# Altium project OFP_MCM_v1.6.PrjPcb (part 5 of 7)
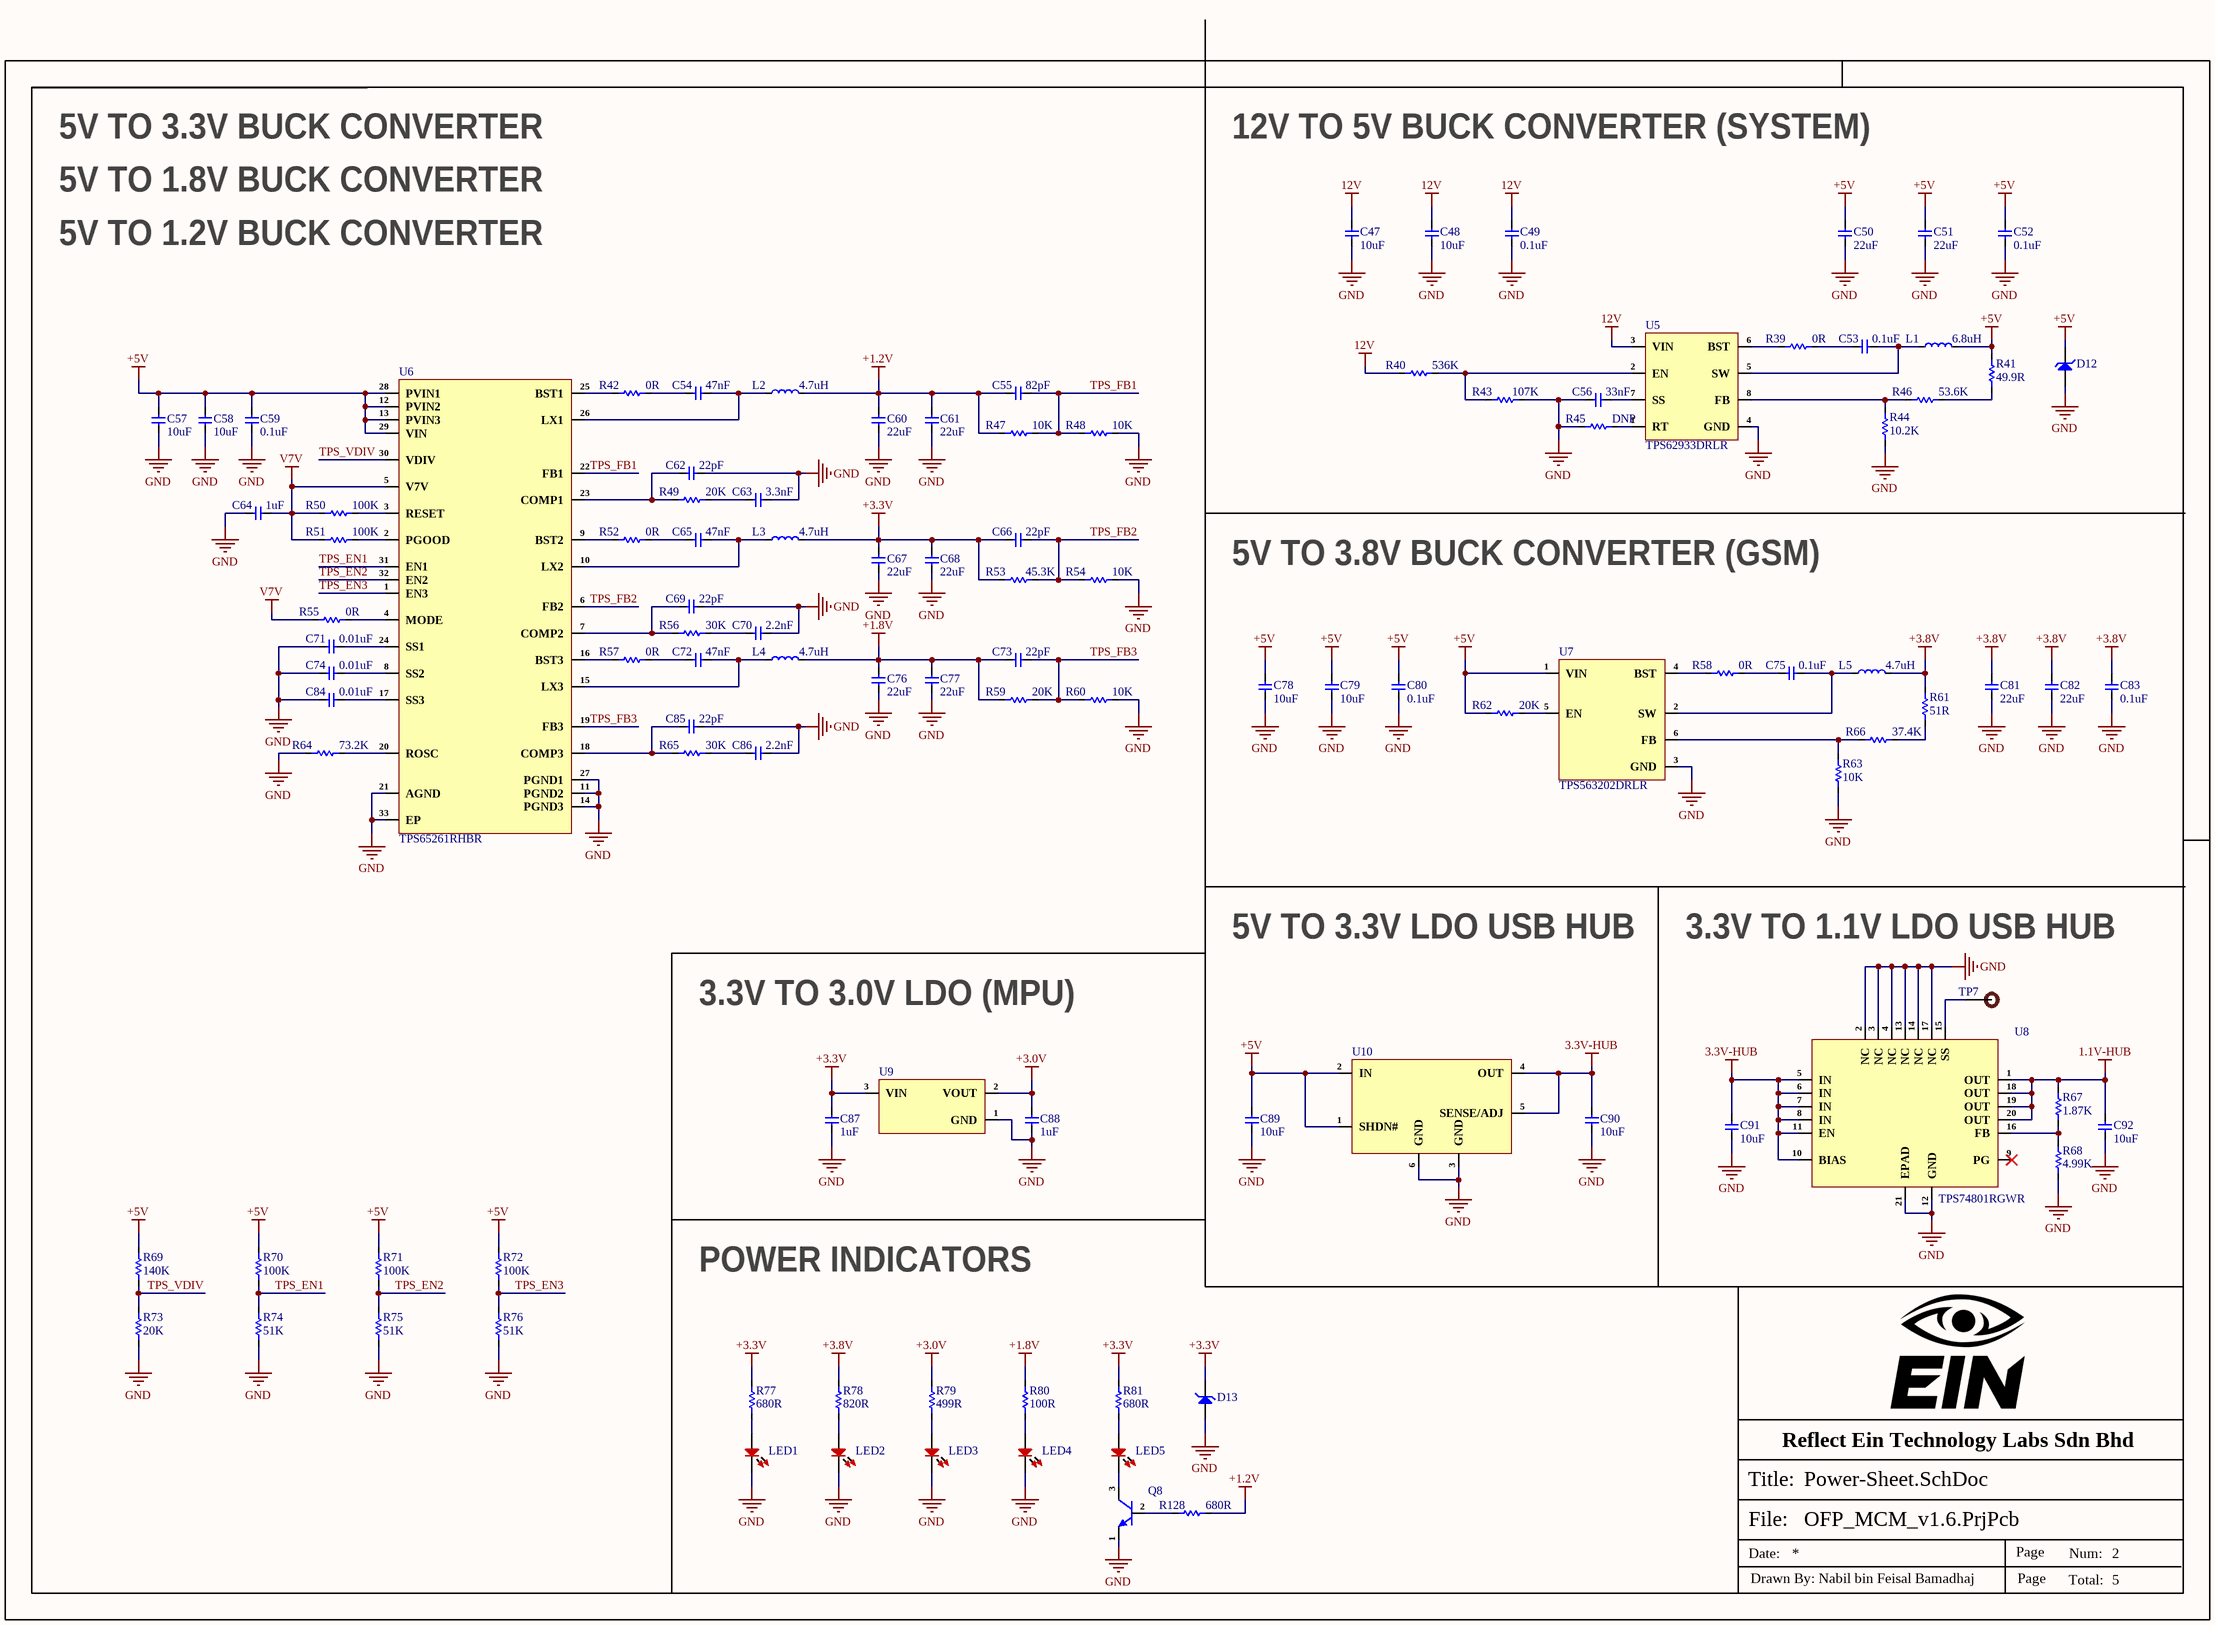
[diagram p8: Power-Sheet.SchDoc]

## Sheet Power-Sheet.SchDoc (continued)

### Library data of the parts (continued)
R74-R76 = RC0603FR-0751KL: RES 51K OHM 1% 1/10W 0603; Manufacturer: Yageo; Item Type: Resistors; Value: 51kR; Power Rating: 100mW; Voltage Rating: 50V; Temperature Coefficient: 100ppm/°C; Supplier: Future Electronics; LCSC Part Number: C107231; Manufacturer Part Number: RC0603FR-0751KL; RoHS: Yes; Stock: 1155000; Pricing: 5000=0.0024, 50000=0.0023, 150000=0.0022, 375000=0.0021, 1000000=0.002 (USD); Case/Package: 0603; Pins: 2NUMBER; Case Code (Imperial): 0603; Case Code (Metric): 1608; Min Operating Temperature: -55°C; Max Operating Temperature: 155°C; Tolerance: 1%; Packaging: Tape and Reel; Package Quantity: 1; Termination: SMD/SMT; Resistor Type: Thick Film; Number of Terminations: 2; Max Power Dissipation: 100mW; Features: Moisture Resistant; Series: RC; Resistance Tolerance: 1%; Technology: THICK FILM; Voltage Rating (DC): 50V; Length: 1.6mm; Width: 0.031inch; Height: 0.45mm; Depth: 0.8mm; Reach SVHC Compliant: No; RoHS Compliant: Yes; Lead Free: 5697LeadFree; ComponentLink1URL: https://datasheet.ciiva.com/11819/0900766b80f96399-11819378.pdf?src-supplier=Rs; ComponentLink1Description: https://datasheet.ciiva.com/11819/0900766b80f96399-11819378.pdf?src-supplier=Rs; ComponentLink2URL: https://datasheet.ciiva.com/46395/443971-46395014.pdf?src-supplier=Element14; ComponentLink2Description: https://datasheet.ciiva.com/46395/443971-46395014.pdf?src-supplier=Element14; ComponentLink3URL: https://datasheet.ciiva.com/2454/pyu-r-int-thick-7-2454124.pdf?src-supplier=Digikey; ComponentLink3Description: https://datasheet.ciiva.com/2454/pyu-r-int-thick-7-2454124.pdf?src-supplier=Digikey; ComponentLink4URL: https://datasheet.ciiva.com/2454/pyu-r-int-thick-7-2454125.pdf?src-supplier=Digikey; ComponentLink4Description: https://datasheet.ciiva.com/2454/pyu-r-int-thick-7-2454125.pdf?src-supplier=Digikey; ComponentLink5URL: https://datasheet.ciiva.com/2454/pyu-r-int-thick-7-2454123.pdf?src-supplier=Digikey; ComponentLink5Description: https://datasheet.ciiva.com/2454/pyu-r-int-thick-7-2454123.pdf?src-supplier=Digikey; ComponentLink6URL: https://datasheet.ciiva.com/12558/rc0603-272842-12558554.pdf?src-supplier=Mouser; ComponentLink6Description: https://datasheet.ciiva.com/12558/rc0603-272842-12558554.pdf?src-supplier=Mouser
R77 R81 R128 = RC0603FR-07680RL: RES SMD 680 OHM 1% 1/10W 0603; Manufacturer: Yageo; Item Type: Resistor; Manufacturer Part Number: RC0603FR-07680RL; Package: 0603; ComponentLink4URL: https://www.lcsc.com/product-detail/Chip-Resistor-Surface-Mount_YAGEO-RC0603FR-07680RL_C112310.html; ComponentLink4Description: LCSC; LCSC Part Number: C112310
R78 = RC0603FR-07820RL: RES 820 OHM 1% 1/10W 0603; Manufacturer: Yageo; Power Rating: 100mW; Voltage Rating: 75V; Voltage Rating (DC): 50V; Temperature Coefficient: 100ppm/°C; Item Type: Resistor; Supplier 1: Future Electronics; Manufacturer Part Number: RC0603FR-07820RL; RoHS: Yes; Category: Chip SMD Resistors; Stock 1: 415000; Pricing 1: 5000=0.002, 50000=0.0014, 100000=0.0018, 200000=0.0014, 375000=0.0018, 625000=0.0013, 1000000=0.0017, 2000000=0.0012, 3750000=0.0016 (USD); Case/Package: 0603; Pins: 2; Case Code (Imperial): 0603; Case Code (Metric): 1608; Weight: 7.1E-05oz; Min Operating Temperature: -55°C; Max Operating Temperature: 155°C; Tolerance: 1%; Value: 820R; Packaging: Tape and Reel; Termination: SMD/SMT; Resistor Type: Thick Film; Features: Moisture Resistant; Series: RC; Max Power Dissipation: 100mW; Number of Terminations: 2; Construction: Rectangular; Resistance Tolerance: 1%; Technology: THICK FILM; Length: 1.6mm; Width: 0.8mm; Height: 0.45mm; Depth: 0.8mm; Military Standard: Not; Lead Free: Lead Free; RoHS Compliant: Yes; Reach SVHC Compliant: Unknown; ComponentLink1URL: http://www.farnell.com/datasheets/1868787.pdf?src-supplier=Farnell; ComponentLink1Description: http://www.farnell.com/datasheets/1868787.pdf?src-supplier=Farnell; ComponentLink2URL: http://www.mouser.com/ds/2/447/RC0603-272842.pdf?src-supplier=Mouser; ComponentLink2Description: http://www.mouser.com/ds/2/447/RC0603-272842.pdf?src-supplier=Mouser; ComponentLink3URL: http://www.farnell.com/datasheets/2167052.pdf?src-supplier=Farnell; ComponentLink3Description: http://www.farnell.com/datasheets/2167052.pdf?src-supplier=Farnell; ComponentLink4URL: https://www.verical.com/server-webapp/html/getDatasheet?partID=358925&src-supplier=Verical; ComponentLink4Description: https://www.verical.com/server-webapp/html/getDatasheet?partID=358925&src-supplier=Verical; ComponentLink5URL: http://www.farnell.com/datasheets/1868787.pdf?src-supplier=Newark; ComponentLink5Description: http://www.farnell.com/datasheets/1868787.pdf?src-supplier=Newark; ComponentLink6URL: http://www.farnell.com/datasheets/1868787.pdf?src-supplier=Element14; ComponentLink6Description: http://www.farnell.com/datasheets/1868787.pdf?src-supplier=Element14; ComponentLink7URL: http://www.yageo.com/documents/recent/PYu-RC_Group_51_RoHS_L_10.pdf?src-supplier=Digi-Key; ComponentLink7Description: http://www.yageo.com/documents/recent/PYu-RC_Group_51_RoHS_L_10.pdf?src-supplier=Digi-Key; ComponentLink8URL: http://www.yageo.com/documents/recent/PYu-RC_Group_51_RoHS_L_9.pdf?src-supplier=Digi-Key; ComponentLink8Description: http://www.yageo.com/documents/recent/PYu-RC_Group_51_RoHS_L_9.pdf?src-supplier=Digi-Key; ComponentLink9URL: http://www.farnell.com/datasheets/2167052.pdf?src-supplier=Newark; ComponentLink9Description: http://www.farnell.com/datasheets/2167052.pdf?src-supplier=Newark; ComponentLink10URL: http://www.yageo.com/documents/recent/PYu-RC0603_51_RoHS_L_7.pdf?src-supplier=Future+Electronics; ComponentLink10Description: http://www.yageo.com/documents/recent/PYu-RC0603_51_RoHS_L_7.pdf?src-supplier=Future+Electronics; Supplier Part Number 1: 8621260; LCSC Part Number: C114638
R79 = RC0603FR-07499RL: RES 499 OHM 1% 1/10W 0603; Manufacturer: Yageo; Temperature Coefficient: 100ppm/°C; Power Rating: 100mW; Voltage Rating: 50V; Supplier 1: RSComponents; Manufacturer Part Number: RC0603FR-07499RL; RoHS: Yes; Category: Chip SMD Resistors; Stock 1: 900; Pricing 1: 5000=0.00300, 10000=0.00300, 15000=0.00300, 20000=0.00200 (GBP); Mount: Surface Mount; Case/Package: 0603; Contact Plating: Tin,Matte; Case Code (Metric): 1608; Case Code (Imperial): 0603; Size Code: 0603; Min Operating Temperature: -55°C; Max Operating Temperature: 155°C; Resistance: 499R; Tolerance: 1%; Resistor Type: Thick Film; Package Quantity: 1; Packaging: Tape and Reel; Number of Terminations: 2; Termination: SMD/SMT; Max Power Dissipation: 100mW; Voltage Rating (DC): 50V; Features: Moisture Resistant; Series: RC; Construction: Rectangular; Technology: THICK FILM; Length: 1.6mm; Width: 0.031inch; Height: 0.45mm; Depth: 0.8mm; Radiation Hardening: No; Military Standard: Not; Lead Free: Lead Free; RoHS Compliant: Yes; ComponentLink1URL: https://datasheet.ciiva.com/11808/0900766b80f96399-11808558.pdf?src-supplier=RSComponents; ComponentLink1Description: https://datasheet.ciiva.com/11808/0900766b80f96399-11808558.pdf?src-supplier=RSComponents; ComponentLink2URL: https://datasheet.ciiva.com/2453/pyu-r-int-thick-7-2453956.pdf?src-supplier=Digi-Key; ComponentLink2Description: https://datasheet.ciiva.com/2453/pyu-r-int-thick-7-2453956.pdf?src-supplier=Digi-Key; ComponentLink3URL: https://datasheet.ciiva.com/2453/pyu-r-int-thick-7-2453957.pdf?src-supplier=Digi-Key; ComponentLink3Description: https://datasheet.ciiva.com/2453/pyu-r-int-thick-7-2453957.pdf?src-supplier=Digi-Key; ComponentLink4URL: https://datasheet.ciiva.com/2453/pyu-r-int-thick-7-2453955.pdf?src-supplier=Digi-Key; ComponentLink4Description: https://datasheet.ciiva.com/2453/pyu-r-int-thick-7-2453955.pdf?src-supplier=Digi-Key; ComponentLink5URL: https://datasheet.ciiva.com/12558/rc0603-272842-12558391.pdf?src-supplier=Mouser; ComponentLink5Description: https://datasheet.ciiva.com/12558/rc0603-272842-12558391.pdf?src-supplier=Mouser; ComponentLink6URL: https://datasheet.ciiva.com/8885/pyu-rc0603-51-rohs-l-4-8885483.pdf?src-supplier=Avnet; ComponentLink6Description: https://datasheet.ciiva.com/8885/pyu-rc0603-51-rohs-l-4-8885483.pdf?src-supplier=Avnet; Supplier Part Number 1: 1995585; LCSC Part Number: C137714
R80 = RC0603FR-07100RL: RES SMD 100 OHM 1% 1/10W 0603; Manufacturer: Yageo; Temperature Coefficient: 100ppm/°C; Voltage Rating (DC): 50V; Power Rating: 100mW; Item Type: Resistor; Supplier 1: Arrow Electronics; Manufacturer Part Number: RC0603FR-07100RL; RoHS: Yes; Category: Chip SMD Resistors; Stock 1: 3800000; Pricing 1: 5000=0.00300, 5000=0.00200, 5000=0.00450, 50000=0.00410, 500000=0.00230, 2500000=0.00140 (USD); Case/Package: 0603; Number of Pins: 2; Case Code (Imperial): 0603; Case Code (Metric): 1608; Size Code: 0603; Min Operating Temperature: -55°C; Max Operating Temperature: 155°C; Resistance: 100R; Tolerance: 1%; Resistor Type: Thick Film; Packaging: Tape and Reel; Voltage Rating: 50V; Termination: SMD/SMT; Features: Moisture Resistant; Series: RC; Max Power Dissipation: 100mW; Number of Terminations: 2; Construction: Rectangular; Resistance Tolerance: 1%; Technology: THICK FILM; Length: 1.6mm; Width: 0.8mm; Height: 0.45mm; Depth: 0.8mm; REACH SVHC: Unknown; Lead Free: Lead Free; RoHS Compliant: Yes; Military Standard: Not; Supplier Part Number 1: RC0603FR-07100RL; LCSC Part Number: C105588
TP7 = TEST POINT 0.5mm Dia: Test Point ON; Item Type: Test Point; Manufacturer Part Number: TEST POINT 0.5mm Dia
U5 = TPS62933DRLR: IC REG BUCK ADJ 3A SOT583; Manufacturer: Texas Instruments; Supplier: Mouser; Supplier Part Number: 595-TPS62933DRLR; Manufacturer Part Number: TPS62933DRLR; RoHS: No; Category: Voltage Regulators - Switching; Stock: 5259; Pricing: 1=0.7, 10=0.581, 50=0.581, 100=0.44, 1000=0.297, 10000=0.241 (USD); LCSC Part Number: C3200405; Item Type: IC
U6 = TPS65261RHBR: IC REG BCK ADJ 3A/2A TRPL 32VQFN; Manufacturer: Texas Instruments; Supplier: Mouser; LCSC Part Number: C138722; Manufacturer Part Number: TPS65261RHBR; RoHS: Yes; Item Type: IC; Stock: 3449; Pricing: 1=2.78, 10=1.91, 50=1.91, 100=1.71, 1000=1.52, 10000=1.32 (USD); ComponentLink1URL: https://datasheet.ciiva.com/29735/tps65261-1-29735186.pdf?src-supplier=Digikey; ComponentLink1Description: https://datasheet.ciiva.com/29735/tps65261-1-29735186.pdf?src-supplier=Digikey
U7 = TPS563202DRLR: IC REG BUCK ADJ 3A SOT563; Manufacturer: Texas Instruments; Number of Channels: 1NUMBER; Supplier: Mouser; LCSC Part Number: C1513007; Manufacturer Part Number: TPS563202DRLR; RoHS: Yes; Item Type: IC; Stock: 5123; Pricing: 1=0.29, 10=0.174, 50=0.174, 100=0.131, 1000=0.125, 10000=0.109 (USD); Pins: 6NUMBER; Length: 1.6mm; Width: 1.2mm; Height: 600um; Thickness: 550um
U8 = TPS74801RGWR: IC REG LIN POS ADJ 1.5A 20VQFN; Manufacturer: Texas Instruments; Supplier: Mouser; LCSC Part Number: C129193; Manufacturer Part Number: TPS74801RGWR; RoHS: Yes; Item Type: IC; Stock: 12482; Pricing: 1=1.87, 10=1.33, 50=1.33, 100=1.19, 1000=1.04, 10000=1.03 (USD); Length: 5mm; Width: 5mm; Height: 1mm; Thickness: 900um; ComponentLink1URL: https://datasheet.ciiva.com/4885/sbvs074j-203573-4885874.pdf?src-supplier=Mouser; ComponentLink1Description: https://datasheet.ciiva.com/4885/sbvs074j-203573-4885874.pdf?src-supplier=Mouser; ComponentLink2URL: https://datasheet.ciiva.com/41462/001015037-da-01-en-ic-reg-ldo-adj-tps74801rgwr-vqfn-20-tid-41462882.pdf?src-supplier=Conrad; ComponentLink2Description: https://datasheet.ciiva.com/41462/001015037-da-01-en-ic-reg-ldo-adj-tps74801rgwr-vqfn-20-tid-41462882.pdf?src-supplier=Conrad; ComponentLink3URL: https://datasheet.ciiva.com/14278/tps74801-14278399.pdf?src-supplier=Avnet; ComponentLink3Description: https://datasheet.ciiva.com/14278/tps74801-14278399.pdf?src-supplier=Avnet; ComponentLink4URL: https://datasheet.ciiva.com/31402/tps74801-31402076.pdf?src-supplier=Farnell; ComponentLink4Description: https://datasheet.ciiva.com/31402/tps74801-31402076.pdf?src-supplier=Farnell; ComponentLink5URL: https://datasheet.ciiva.com/2044/tps74801-2044836.pdf?src-supplier=Digikey; ComponentLink5Description: https://datasheet.ciiva.com/2044/tps74801-2044836.pdf?src-supplier=Digikey; ComponentLink6URL: https://datasheet.ciiva.com/2044/tps74801-2044837.pdf?src-supplier=Digikey; ComponentLink6Description: https://datasheet.ciiva.com/2044/tps74801-2044837.pdf?src-supplier=Digikey; ComponentLink7URL: https://datasheet.ciiva.com/2044/tps74801-2044838.pdf?src-supplier=Digikey; ComponentLink7Description: https://datasheet.ciiva.com/2044/tps74801-2044838.pdf?src-supplier=Digikey
U9 = XC6206P302MR-G: IC REG LINEAR 3V 200MA SOT23; Manufacturer: Torex; Number of Channels: 1NUMBER; Supplier: Mouser; LCSC Part Number: C9972; Manufacturer Part Number: XC6206P302MR-G; RoHS: Yes; Item Type: IC; Stock: 15826; Pricing: 1=0.68, 10=0.543, 50=0.543, 100=0.417, 1000=0.271, 10000=0.214 (USD); Output Voltage: 3V; ComponentLink1URL: https://www.torexsemi.com/file/xc6206/XC6206.pdf?src-supplier=Digikey; ComponentLink1Description: https://www.torexsemi.com/file/xc6206/XC6206.pdf?src-supplier=Digikey; ComponentLink2URL: https://datasheet.octopart.com/XC6206P302MR-G-Torex-datasheet-134531119.pdf?src-supplier=TME; ComponentLink2Description: https://datasheet.octopart.com/XC6206P302MR-G-Torex-datasheet-134531119.pdf?src-supplier=TME
U10 = TPS7A4533DCQR: IC REG LINEAR 3.3V 1.5A SOT223-6; Manufacturer: Texas Instruments; Dropout Voltage: 300mV; Number of Outputs: 1; Max Supply Voltage: 20V; Min Input Voltage: 2.1V; Min Current Limit: 1.6A; Input Bias Current: 1mA; Polarity: Positive; Accuracy: 1%; Output Type: Fixed; Supplier: Mouser; LCSC Part Number: 595-TPS7A4533DCQR; Manufacturer Part Number: TPS7A4533DCQR; RoHS: Yes; Item Type: IC; Stock: 854; Pricing: 1=3.2, 10=2.35, 50=2.35, 100=2.14, 1000=2, 10000=1.87 (USD); Case/Package: SOT-223-6; Pins: 6; Min Operating Temperature: -40°C; Max Operating Temperature: 125°C; Output Voltage: 3.3V; Package Quantity: 2500; Packaging: Tape and Reel; Output Current: 1.5A; Max Output current: 1.5A; Number of Regulators: 1; Quiescent Current: 1mA; Max Output Voltage: 3.3V; Min Output Voltage: 3.3V; Series: -; Radiation Hardening: No; Lead Free: Lead Free; RoHS Compliant: Yes; ComponentLink1URL: https://datasheet.ciiva.com/2046/tps7a4515-2046240.pdf?src-supplier=Digikey; ComponentLink1Description: https://datasheet.ciiva.com/2046/tps7a4515-2046240.pdf?src-supplier=Digikey; ComponentLink2URL: https://datasheet.ciiva.com/29569/tps7a4501-29569717.pdf?src-supplier=Digikey; ComponentLink2Description: https://datasheet.ciiva.com/29569/tps7a4501-29569717.pdf?src-supplier=Digikey; ComponentLink3URL: https://datasheet.ciiva.com/29569/tps7a4501-29569718.pdf?src-supplier=Digikey; ComponentLink3Description: https://datasheet.ciiva.com/29569/tps7a4501-29569718.pdf?src-supplier=Digikey; ComponentLink4URL: https://datasheet.ciiva.com/29569/tps7a4501-29569719.pdf?src-supplier=Digikey; ComponentLink4Description: https://datasheet.ciiva.com/29569/tps7a4501-29569719.pdf?src-supplier=Digikey

## Sheet RGB-LCD-Sheet.SchDoc
size 420 x 297 mm; SheetNumber: 3; SheetTotal: 5
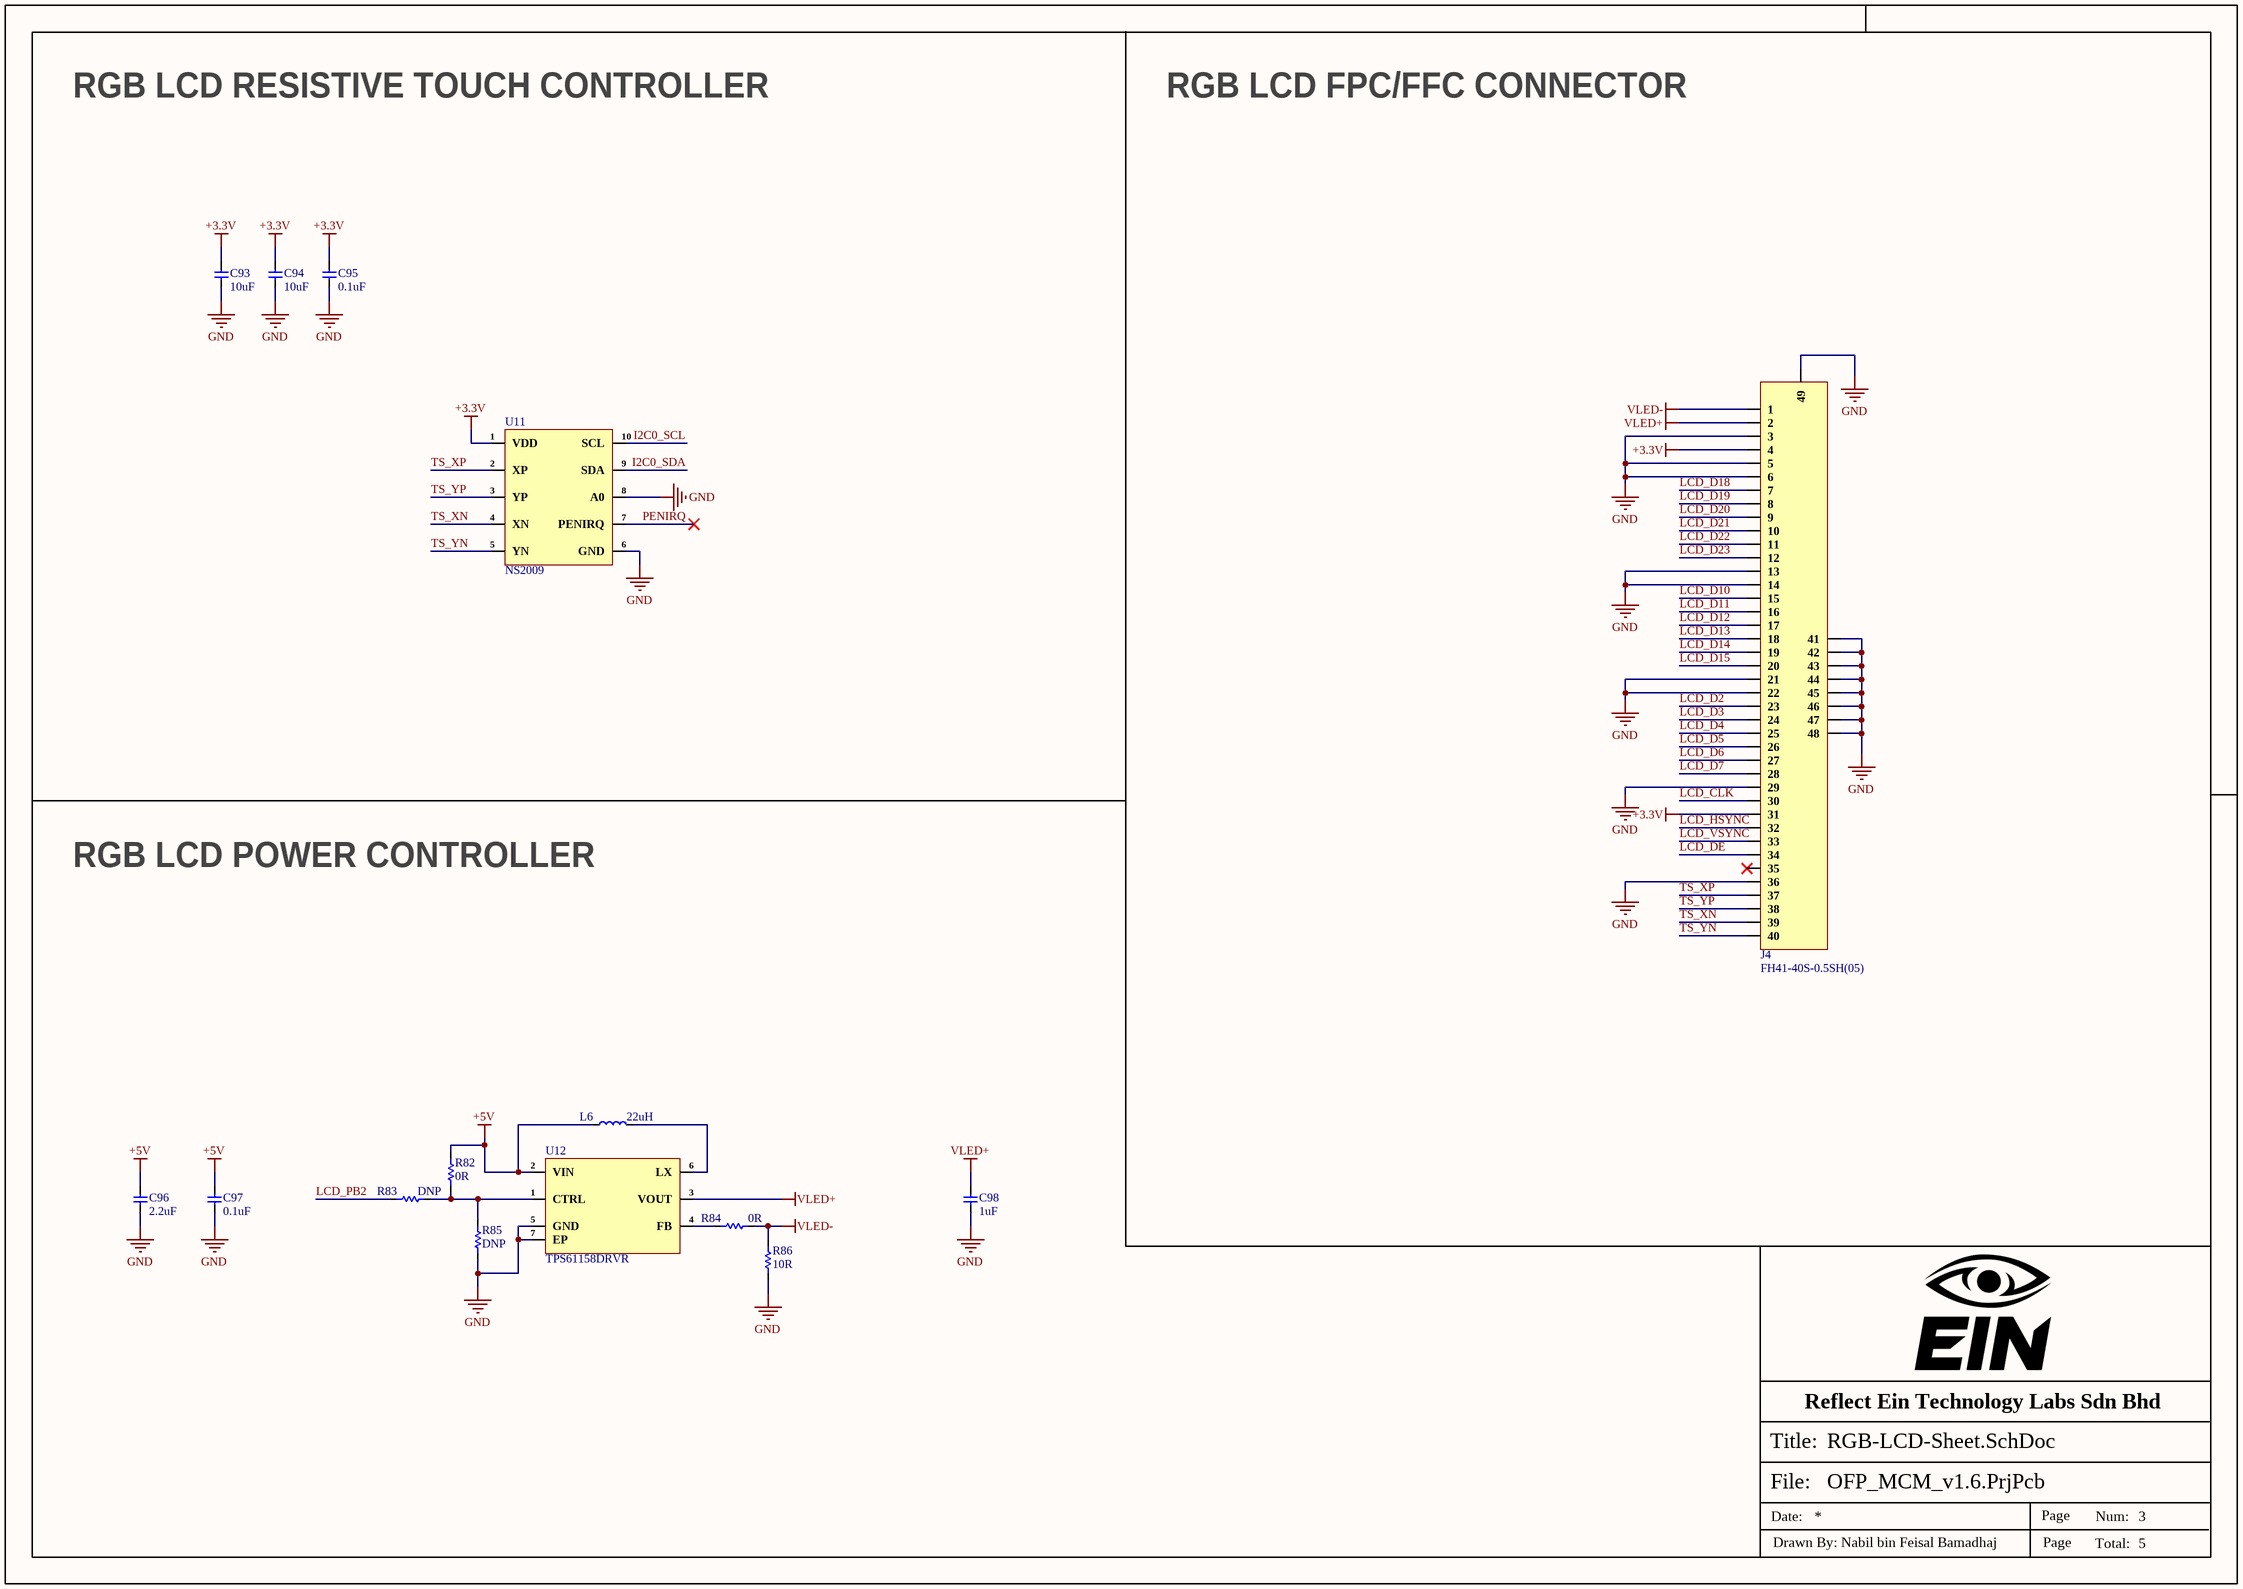
[diagram p2: RGB-LCD-Sheet.SchDoc]

### Parts
C93  10uF  [Cap-0603]
C94  10uF  [Cap-0603]
C95  0.1uF  [Cap-0402]
C96  2.2uF  [Cap-0603]
C97  0.1uF  [Cap-0402]
C98  1uF  [Cap-0603]
J4  FH41-40S-0.5SH(05)  [FH41-40S-0.5SH(05)]
L6  22uH  [YNR4018-220M]
R82  0R  [Res-0603]
R83  DNP  [Res-0603]
R84  0R  [Res-0603]
R85  DNP  [Res-0603]
R86  10R  [Res-0603]
U11  NS2009  [10-MSOP]
U12  TPS61158DRVR  [WSON-6-EP(2x2)]

### Nets
+3.3V: C93.2 C94.2 C95.2 J4.4 J4.31 U11.1(VDD)
+5V: C96.2 C97.2 L6.1 R82.2 U12.2(VIN)
GND: C93.1 C94.1 C95.1 C96.1 C97.1 C98.1 J4.3 J4.5 J4.6 J4.13 J4.14 J4.21 J4.22 J4.29 J4.36 J4.41 J4.42 J4.43 J4.44 J4.45 J4.46 J4.47 J4.48 J4.49 R85.1 R86.1 U11.6(GND) U11.8(A0) U12.5(GND) U12.7(EP)
VLED+: C98.2 J4.2 U12.3(VOUT)
VLED-: J4.1 R84.2 R86.2
I2C0_SCL: U11.10(SCL)
I2C0_SDA: U11.9(SDA)
LCD_CLK: J4.30
LCD_D2: J4.23
LCD_D3: J4.24
LCD_D4: J4.25
LCD_D5: J4.26
LCD_D6: J4.27
LCD_D7: J4.28
LCD_D10: J4.15
LCD_D11: J4.16
LCD_D12: J4.17
LCD_D13: J4.18
LCD_D14: J4.19
LCD_D15: J4.20
LCD_D18: J4.7
LCD_D19: J4.8
LCD_D20: J4.9
LCD_D21: J4.10
LCD_D22: J4.11
LCD_D23: J4.12
LCD_DE: J4.34
LCD_HSYNC: J4.32
LCD_PB2: R83.1
LCD_VSYNC: J4.33
PENIRQ: U11.7(PENIRQ)
TS_XN: J4.39 U11.4(XN)
TS_XP: J4.37 U11.2(XP)
TS_YN: J4.40 U11.5(YN)
TS_YP: J4.38 U11.3(YP)
NetL6_2: L6.2 U12.6(LX)
NetR82_1: R82.1 R83.2 R85.2 U12.1(CTRL)
NetR84_1: R84.1 U12.4(FB)

Not connected (* = marked no-connect by the designer): J4 35*

### Notes on the sheet
- RGB LCD RESISTIVE TOUCH CONTROLLER
- RGB LCD FPC/FFC CONNECTOR
- RGB LCD POWER CONTROLLER
- Reflect Ein Technology Labs Sdn Bhd
- File:
- Title:
- Date:
- Page
- Num:
- Total:
- Drawn By: Nabil bin Feisal Bamadhaj

### Library data of the parts
C93 C94 = GRM188Z71A106KA73D: CAP CER 10UF 10V X7R 0603; Manufacturer: Murata; Item Type: Capacitor; Material: 4241ConductorMaterial; Tolerance: 10%; Supplier: Mouser; LCSC Part Number: C2959727; Manufacturer Part Number: GRM188Z71A106KA73D; RoHS: Yes; Stock: 390983; Pricing: 1=0.36, 10=0.155, 50=0.155, 100=0.104, 1000=0.094, 10000=0.065 (USD); Case/Package: 345Case; Min Operating Temperature: -55°C; Max Operating Temperature: 125°C; Value: 10uF; Voltage Rating: 10V; Length: 1.6mm; Width: 800um; Height: 1mm; Thickness: 800um; RoHS Compliant: Yes; ComponentLink1URL: https://datasheet.octopart.com/GRM188Z71A106KA73D-Murata-datasheet-165579666.pdf?src-supplier=TME; ComponentLink1Description: https://datasheet.octopart.com/GRM188Z71A106KA73D-Murata-datasheet-165579666.pdf?src-supplier=TME
C95 C97 = GRM155R71E104KE14D: CAP CER 0.1UF 25V X7R 0402; Manufacturer: Murata; Item Type: Capacitors; Dielectric Material: Ceramic; Material: 4241ConductorMaterial; Value: 100nF; Tolerance: 10%; Supplier: Mouser; LCSC Part Number: C77014; Manufacturer Part Number: GRM155R71E104KE14D; RoHS: Yes; Stock: 652368; Pricing: 1=0.1, 10=0.007, 50=0.007, 100=0.005, 1000=0.005, 10000=0.004 (USD); Mounting Technology: Surface Mount; Case/Package: 0402; Pins: 2NUMBER; Case Code (Metric): 1005; Case Code (Imperial): 0402; Weight: 0.000212oz; Min Operating Temperature: -55°C; Max Operating Temperature: 125°C; Packaging: Tape and Reel; Voltage Rating: 25V; Dielectric: X7R; Voltage: 25V; Termination: SMD/SMT; Voltage Rating (DC): 25V; Package Quantity: 10000; Series: GRM; Length: 1mm; Width: 0.02inch; Height: 0.5mm; Thickness: 0.022inch; Depth: 0.5mm; RoHS Compliant: Yes; Reach SVHC Compliant: Unknown; Lead Free: 5697LeadFree; ComponentLink1URL: http://www.farnell.com/datasheets/1872206.pdf?src-supplier=Farnell; ComponentLink1Description: http://www.farnell.com/datasheets/1872206.pdf?src-supplier=Farnell; ComponentLink2URL: http://www.mouser.com/ds/2/281/c02e-2905.pdf?src-supplier=Mouser; ComponentLink2Description: http://www.mouser.com/ds/2/281/c02e-2905.pdf?src-supplier=Mouser; ComponentLink3URL: http://uk.rs-online.com/webdocs/144c/0900766b8144c113.pdf?src-supplier=Rs; ComponentLink3Description: http://uk.rs-online.com/webdocs/144c/0900766b8144c113.pdf?src-supplier=Rs; ComponentLink4URL: https://datasheet.octopart.com/GRM155R71E104KE14D-Murata-datasheet-62346597.pdf?src-supplier=Future+Electronics; ComponentLink4Description: https://datasheet.octopart.com/GRM155R71E104KE14D-Murata-datasheet-62346597.pdf?src-supplier=Future+Electronics; ComponentLink5URL: https://search.murata.co.jp/Ceramy/image/img/A01X/G101/ENG/GRM155R71E104KE14-01.pdf?src-supplier=Digikey; ComponentLink5Description: https://search.murata.co.jp/Ceramy/image/img/A01X/G101/ENG/GRM155R71E104KE14-01.pdf?src-supplier=Digikey; ComponentLink6URL: http://www.farnell.com/datasheets/2048008.pdf?src-supplier=Newark; ComponentLink6Description: http://www.farnell.com/datasheets/2048008.pdf?src-supplier=Newark; ComponentLink7URL: https://datasheet.octopart.com/GRM155R71E104KE14D-Murata-datasheet-62317124.pdf?src-supplier=Element14; ComponentLink7Description: https://datasheet.octopart.com/GRM155R71E104KE14D-Murata-datasheet-62317124.pdf?src-supplier=Element14; ComponentLink8URL: http://psearch.en.murata.com/capacitor/product/GRM155R71E104KE14%23.pdf?src-supplier=Avnet; ComponentLink8Description: http://psearch.en.murata.com/capacitor/product/GRM155R71E104KE14%23.pdf?src-supplier=Avnet
C96 = CC0603KRX7R7BB225: CAP CER 2.2UF 16V X7R 0603; Manufacturer: Yageo; Item Type: Capacitors; Material: 4241ConductorMaterial; Dielectric: 1511DielectricType; Tolerance: 10%; Supplier: Future Electronics; LCSC Part Number: C914769; Manufacturer Part Number: CC0603KRX7R7BB225; RoHS: Yes; Stock: 100000; Pricing: 4000=0.0676, 8000=0.0665, 12000=0.0658, 16000=0.0654, 20000=0.0639 (USD); Mounting Technology: Surface Mount; Case/Package: 0603; Case Code (Imperial): 0603; Case Code (Metric): 1608; Min Operating Temperature: -55°C; Max Operating Temperature: 125°C; Series: CC; Packaging: Cut Tape; Voltage Rating: 16V; Voltage Rating (DC): 16V; Value: 2.2uF; Height: 900um; RoHS Compliant: Yes; Halogen Free: 5694HalogenFree; Lead Free: 5697LeadFree; ComponentLink1URL: https://datasheet.octopart.com/CC0603KRX7R7BB225-Yageo-datasheet-166511530.pdf?src-supplier=Future+Electronics; ComponentLink1Description: https://datasheet.octopart.com/CC0603KRX7R7BB225-Yageo-datasheet-166511530.pdf?src-supplier=Future+Electronics; ComponentLink2URL: http://www.yageo.com/documents/recent/UPY-GPHC_X7R_6.3V-to-50V_18.pdf?src-supplier=Digikey; ComponentLink2Description: http://www.yageo.com/documents/recent/UPY-GPHC_X7R_6.3V-to-50V_18.pdf?src-supplier=Digikey; ComponentLink3URL: https://datasheet.octopart.com/CC0603KRX7R7BB225-Yageo-datasheet-151948686.pdf?src-supplier=Farnell; ComponentLink3Description: https://datasheet.octopart.com/CC0603KRX7R7BB225-Yageo-datasheet-151948686.pdf?src-supplier=Farnell
C98 = CC0603KRX7R9BB105: CAP CER 1UF 50V X7R 0603; Manufacturer: Yageo; Item Type: Capacitors; Material: 4241ConductorMaterial; Tolerance: 10%; Supplier: Rs; LCSC Part Number: C559769; Manufacturer Part Number: CC0603KRX7R9BB105; RoHS: Yes; Stock: 950; Mounting Technology: Surface Mount; Case/Package: 0603; Case Code (Metric): 1608; Case Code (Imperial): 0603; Weight: 7.1E-05oz; Min Operating Temperature: -55°C; Max Operating Temperature: 125°C; Value: 1uF; Dielectric: X7R; Packaging: Tape and Reel; Voltage Rating: 50V; Termination: SMD/SMT; Voltage Rating (DC): 50V; Package Quantity: 4000; Series: CC; Length: 0.063inch; Width: 0.031inch; Height: 900um; Thickness: 0.035inch; Lead Free: Lead Free; RoHS Compliant: Yes; Halogen Free: 5694HalogenFree; ComponentLink1URL: http://www.mouser.com/ds/2/447/Yageo_UPY-GP_NP0_16V-to-50V_9-358835.pdf?src-supplier=Mouser; ComponentLink1Description: http://www.mouser.com/ds/2/447/Yageo_UPY-GP_NP0_16V-to-50V_9-358835.pdf?src-supplier=Mouser; ComponentLink2URL: http://www.yageo.com/documents/recent/UPY-GPHC_X7R_6.3V-to-50V_18.pdf?src-supplier=Digikey; ComponentLink2Description: http://www.yageo.com/documents/recent/UPY-GPHC_X7R_6.3V-to-50V_18.pdf?src-supplier=Digikey; ComponentLink3URL: https://datasheet.octopart.com/CC0603KRX7R9BB105-Yageo-datasheet-137700082.pdf?src-supplier=Future+Electronics; ComponentLink3Description: https://datasheet.octopart.com/CC0603KRX7R9BB105-Yageo-datasheet-137700082.pdf?src-supplier=Future+Electronics
J4 = FH41-40S-0.5SH(05): CONN FFC BOTTOM 40POS 0.5MM R/A; Manufacturer: Hirose; Item Type: Card Edge Connectors; Connector Type: 4640ConnectorType; Supplier: Digikey; LCSC Part Number: C596805; Manufacturer Part Number: FH41-40S-0.5SH(05); RoHS: Yes; Stock: 4133; Pricing: 1=2.72, 10=2.313, 25=2.1676, 50=2.064, 100=1.9654, 250=1.84232, 500=1.75438, 1000=1.7289 (USD); Length: 24mm; Width: 6.2mm; Height: 2.5mm; RoHS Compliant: 5897YesNo; ComponentLink1URL: https://datasheet.ciiva.com/11745/0900766b80fce72e-11745604.pdf?src-supplier=Rs; ComponentLink1Description: https://datasheet.ciiva.com/11745/0900766b80fce72e-11745604.pdf?src-supplier=Rs; ComponentLink2URL: https://datasheet.ciiva.com/7989/1512288-7989402.pdf?src-supplier=Element14; ComponentLink2Description: https://datasheet.ciiva.com/7989/1512288-7989402.pdf?src-supplier=Element14; ComponentLink3URL: https://datasheet.ciiva.com/5772/1512288-5772907.pdf?src-supplier=Farnell; ComponentLink3Description: https://datasheet.ciiva.com/5772/1512288-5772907.pdf?src-supplier=Farnell
L6 = YNR4018-220M: 590mA 22uH ±20% SMD,4x4x1.8mm Power Inductors ROHS; Manufacturer: YJYCOIN; Manufacturer Part Number: YNR4018-220M; Package: SMD,4x4x1.8mm; LCSC Part Number: C340373; Item Type: Inductor; ComponentLink1Description: LCSC; ComponentLink1URL: https://www.lcsc.com/product-detail/Power-Inductors_YJYCOIN-YNR4018-220M_C340373.html
R82-R84 = RC0603FR-070RL: RES SMD 0R, 1%, 0.1W, 0603; Manufacturer: Yageo; Item Type: Resistor; Manufacturer Part Number: RC0603FR-070RL; Package: 0603; LCSC Part Number: C100044; ComponentLink9Description: LCSC; ComponentLink9URL: https://www.lcsc.com/product-detail/Chip-Resistor-Surface-Mount_YAGEO-RC0603FR-070RL_C100044.html
R85 = RC0603FR-0710KL: RES SMD 10K Ohm 1% 1/10W 0603; Manufacturer: Yageo; Resistance: 10kR; Temperature Coefficient: 100ppm/°C; Voltage Rating (DC): 50V; Power Rating: 100mW; Voltage Rating: 75V; Item Type: Resistor; Supplier 1: Digi-Key; Manufacturer Part Number: RC0603FR-0710KL; RoHS: Yes; Category: Chip SMD Resistors; Stock 1: 25249139; Pricing 1: 1=0.10000, 10=0.02400, 100=0.00970, 1000=0.00436, 2500=0.00378 (USD); Case/Package: 0603; Number of Pins: 2; Case Code (Imperial): 0603; Case Code (Metric): 1608; Weight: 7.1E-05oz; Size Code: 0603; Min Operating Temperature: -55°C; Max Operating Temperature: 155°C; Tolerance: 1%; Resistor Type: Thick Film; Packaging: Tape and Reel; Termination: SMD/SMT; Features: Moisture Resistant; Series: RC; Max Power Dissipation: 100mW; Number of Terminations: 2; Resistance Tolerance: 1%; Construction: Rectangular; Length: 1.6mm; Width: 0.8mm; Height: 0.45mm; Depth: 0.8mm; Lead Pitch: 0.3mm; REACH SVHC: Unknown; Lead Free: Lead Free; Military Standard: Not; RoHS Compliant: Yes; ComponentLink1URL: https://datasheet.ciiva.com/7660/38590-7660789.pdf?src-supplier=Element14; ComponentLink1Description: https://datasheet.ciiva.com/7660/38590-7660789.pdf?src-supplier=Element14; ComponentLink2URL: https://datasheet.ciiva.com/7983/443971-7983596.pdf?src-supplier=Element14; ComponentLink2Description: https://datasheet.ciiva.com/7983/443971-7983596.pdf?src-supplier=Element14; ComponentLink3URL: https://datasheet.ciiva.com/22747/443971-22747519.pdf?src-supplier=Element14; ComponentLink3Description: https://datasheet.ciiva.com/22747/443971-22747519.pdf?src-supplier=Element14; ComponentLink4URL: https://datasheet.ciiva.com/46440/1868787-46440891.pdf?src-supplier=Element14; ComponentLink4Description: https://datasheet.ciiva.com/46440/1868787-46440891.pdf?src-supplier=Element14; ComponentLink5URL: https://datasheet.ciiva.com/7746/1738695-7746239.pdf?src-supplier=Element14; ComponentLink5Description: https://datasheet.ciiva.com/7746/1738695-7746239.pdf?src-supplier=Element14; ComponentLink6URL: https://datasheet.ciiva.com/15189/getdatasheetpartid-409289-15189591.pdf?src-supplier=Verical; ComponentLink6Description: https://datasheet.ciiva.com/15189/getdatasheetpartid-409289-15189591.pdf?src-supplier=Verical; Supplier Part Number 1: 311-10.0KHRCT-ND; LCSC Part Number: C98220
R86 = RC0603FR-0710RL: RES SMD 10 OHM 1% 1/10W 0603; Manufacturer: Yageo; Temperature Coefficient: 200ppm/°C; Power Rating: 100mW; Voltage Rating: 50V; Item type: Resistor; Supplier 1: Digi-Key; Manufacturer Part Number: RC0603FR-0710RL; Stock 1: 10836596; Pricing 1: 1=0.1, 10=0.046, 100=0.0187, 1000=0.0084, 2500=0.00729 (USD); Case/Package: 0603; Number of Pins: 2; Case Code (Imperial): 0603; Case Code (Metric): 1608; Contact Plating: Tin,Matte; Min Operating Temperature: -55°C; Max Operating Temperature: 155°C; Resistance: 10R; Tolerance: 1%; Composition: Thick Film; Packaging: Tape and Reel; Voltage Rating (DC): 50V; Termination: SMD/SMT; Military Standard: Not; Length: 1.6mm; Height: 0.45mm; Width: 0.8mm; Depth: 0.8mm; Radiation Hardening: No; Lead Free: Lead Free; REACH SVHC: No SVHC; ComponentLink1URL: http://www.farnell.com/datasheets/1868787.pdf?src-supplier=Element14; ComponentLink1Description: http://www.farnell.com/datasheets/1868787.pdf?src-supplier=Element14; ComponentLink2URL: http://www.yageo.com/documents/recent/PYu-RC0603_51_RoHS_L_4.pdf?src-supplier=Avnet; ComponentLink2Description: http://www.yageo.com/documents/recent/PYu-RC0603_51_RoHS_L_4.pdf?src-supplier=Avnet; ComponentLink3URL: http://documents.rs-components.com/techlib://itc_doclist_GB.htm?stockno=5048984&src-supplier=RSComponents; ComponentLink3Description: http://documents.rs-components.com/techlib://itc_doclist_GB.htm?stockno=5048984&src-supplier=RSComponents; ComponentLink4URL: http://www.yageo.com/documents/recent/PYu-RC0603_51_RoHS_L_4.pdf?src-supplier=Avnet+Europe; ComponentLink4Description: http://www.yageo.com/documents/recent/PYu-RC0603_51_RoHS_L_4.pdf?src-supplier=Avnet+Europe; Supplier Part Number 1: 311-10.0HRDKR-ND; LCSC Part Number: C109318
U11 = NS2009: MSOP-10 Touch Screen Controllers ROHS; Manufacturer: Shenzhen Nsiway Tech; Item Type: IC; Manufacturer Part Number: NS2009; Package: MSOP-10; LCSC Part Number: C219024; ComponentLink1Description: LCSC; ComponentLink1URL: https://www.lcsc.com/product-detail/Touch-Screen-Controllers_Shenzhen-Nsiway-Tech-NS2009_C219024.html?s_z=n_NS2009
U12 = TPS61158DRVR: IC LED DRVR RGLTR PWM 30MA 6WSON; Manufacturer: Texas Instruments; Supplier: Mouser; LCSC Part Number: C702280; Manufacturer Part Number: TPS61158DRVR; RoHS: Yes; Item Type: IC; Stock: 6942; Pricing: 1=0.81, 10=0.594, 50=0.594, 100=0.489, 1000=0.446, 10000=0.4 (USD); ComponentLink1URL: https://datasheet.ciiva.com/26932/getdatasheetpartid-782062-26932814.pdf?src-supplier=Verical; ComponentLink1Description: https://datasheet.ciiva.com/26932/getdatasheetpartid-782062-26932814.pdf?src-supplier=Verical; ComponentLink2URL: https://datasheet.ciiva.com/24016/slvsbr3-261171-24016309.pdf?src-supplier=Mouser; ComponentLink2Description: https://datasheet.ciiva.com/24016/slvsbr3-261171-24016309.pdf?src-supplier=Mouser; ComponentLink3URL: https://datasheet.ciiva.com/18569/tps61158-18569084.pdf?src-supplier=Digikey; ComponentLink3Description: https://datasheet.ciiva.com/18569/tps61158-18569084.pdf?src-supplier=Digikey

## Sheet GSM-USB-HUB-Sheet.SchDoc
size 420 x 297 mm; SheetNumber: 4; SheetTotal: 5
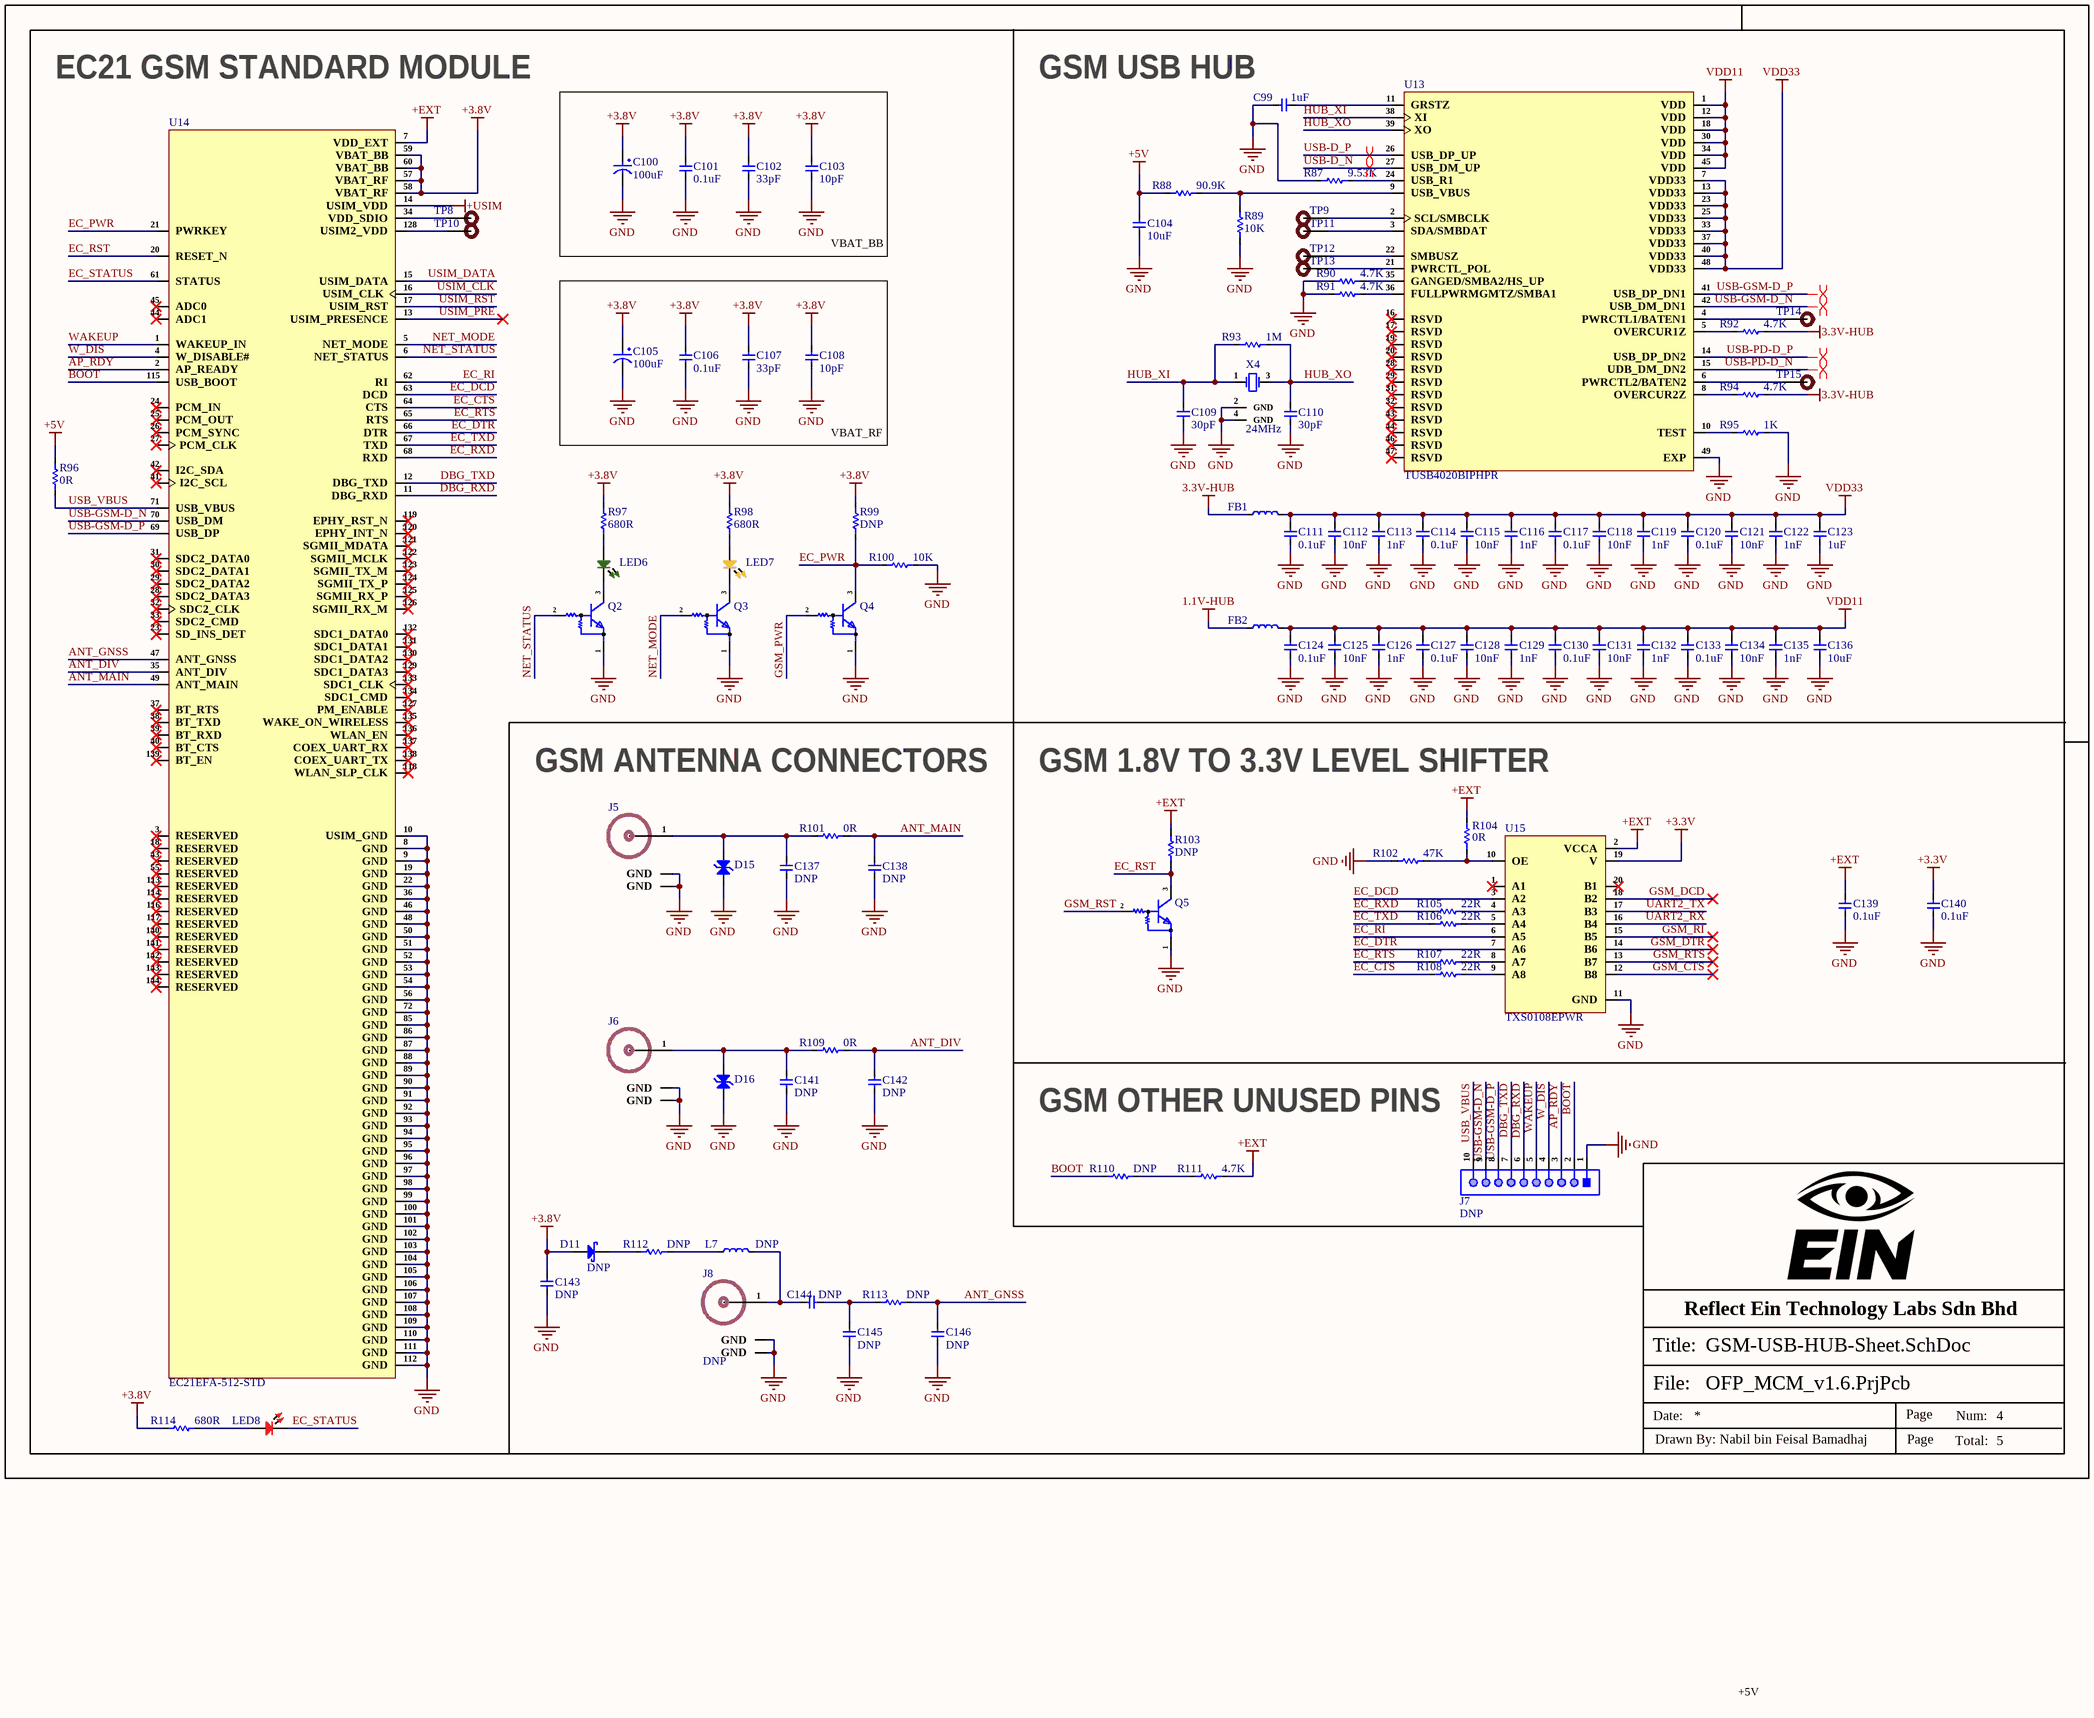
[diagram p3: GSM-USB-HUB-Sheet.SchDoc]

### Parts
C99  1uF  [Cap-0603]
C100  100uF  [Case-A]
C101  0.1uF  [Cap-0603]
C102  33pF  [Cap-0603]
C103  10pF  [Cap-0603]
C104  10uF  [Cap-1210]
C105  100uF  [Case-A]
C106  0.1uF  [Cap-0603]
C107  33pF  [Cap-0603]
C108  10pF  [Cap-0603]
C109  30pF  [Cap-0603]
C110  30pF  [Cap-0603]
C111  0.1uF  [Cap-0402]
C112  10nF  [Cap-0402]
C113  1nF  [Cap-0402]
C114  0.1uF  [Cap-0402]
C115  10nF  [Cap-0402]
C116  1nF  [Cap-0402]
C117  0.1uF  [Cap-0402]
C118  10nF  [Cap-0402]
C119  1nF  [Cap-0402]
C120  0.1uF  [Cap-0402]
C121  10nF  [Cap-0402]
C122  1nF  [Cap-0402]
C123  1uF  [Cap-0402]
C124  0.1uF  [Cap-0402]
C125  10nF  [Cap-0402]
C126  1nF  [Cap-0402]
C127  0.1uF  [Cap-0402]
C128  10nF  [Cap-0402]
C129  1nF  [Cap-0402]
C130  0.1uF  [Cap-0402]
C131  10nF  [Cap-0402]
C132  1nF  [Cap-0402]
C133  0.1uF  [Cap-0402]
C134  10nF  [Cap-0402]
C135  1nF  [Cap-0402]
C136  10uF  [Cap-0402]
C137  DNP  [Cap-0402]
C138  DNP  [Cap-0402]
C139  0.1uF  [Cap-0603]
C140  0.1uF  [Cap-0603]
C141  DNP  [Cap-0402]
C142  DNP  [Cap-0402]
C143  DNP  [Cap-0603]
C144  DNP  [Cap-0402]
C145  DNP  [Cap-0402]
C146  DNP  [Cap-0402]
D11  DNP  [SOD-123]
D15  TPD1E0B04DPYR  [2-X1SON (1x.60)]  (value not drawn)
D16  TPD1E0B04DPYR  [2-X1SON (1x.60)]  (value not drawn)
FB1  BLM18PG221SN1D  [IND-0603 (1608 Metric)]  (value not drawn)
FB2  BLM18PG221SN1D  [IND-0603 (1608 Metric)]  (value not drawn)
J5  U.FL-R-SMT(10)  [U.FL-R-SMT(10)]  (value not drawn)
J6  U.FL-R-SMT(10)  [U.FL-R-SMT(10)]  (value not drawn)
J7  DNP  [HDR 1X10 male]
J8  DNP  [U.FL-R-SMT(10)]
L7  DNP  [IND-0603 (1608 Metric)]
LED6  GREEN  [TH LED 5mm Green]  (value not drawn)
LED7  YELLOW  [TH LED 5mm Yellow]  (value not drawn)
LED8  RED  [LED-0603]  (value not drawn)
Q2  DTC143ZETL  [SOT-416]  (value not drawn)
Q3  DTC143ZETL  [SOT-416]  (value not drawn)
Q4  DTC143ZETL  [SOT-416]  (value not drawn)
Q5  DTC143ZETL  [SOT-416]  (value not drawn)
R87  9.53K  [Res-0402]
R88  90.9K  [Res-0603]
R89  10K  [Res-0603]
R90  4.7K  [Res-0402]
R91  4.7K  [Res-0402]
R92  4.7K  [Res-0402]
R93  1M  [Res-0603]
R94  4.7K  [Res-0402]
R95  1K  [Res-0603]
R96  0R  [Res-0402]
R97  680R  [Res-0603]
R98  680R  [Res-0603]
R99  DNP  [Res-0603]
R100  10K  [Res-0603]
R101  0R  [Res-0402]
R102  47K  [Res-0603]
R103  DNP  [Res-0603]
R104  0R  [Res-0603]
R105  22R  [Res-0603]
R106  22R  [Res-0603]
R107  22R  [Res-0603]
R108  22R  [Res-0603]
R109  0R  [Res-0402]
R110  DNP  [Res-0603]
R111  4.7K  [Res-0603]
R112  DNP  [Res-0603]
R113  DNP  [Res-0402]
R114  680R  [Res-0603]
TP8  TEST POINT 0.5mm Dia  [Test-point - 0.5mm]  (value not drawn)  (no BOM)
TP9  TEST POINT 0.5mm Dia  [Test-point - 0.5mm]  (value not drawn)  (no BOM)
TP10  TEST POINT 0.5mm Dia  [Test-point - 0.5mm]  (value not drawn)  (no BOM)
TP11  TEST POINT 0.5mm Dia  [Test-point - 0.5mm]  (value not drawn)  (no BOM)
TP12  TEST POINT 0.5mm Dia  [Test-point - 0.5mm]  (value not drawn)  (no BOM)
TP13  TEST POINT 0.5mm Dia  [Test-point - 0.5mm]  (value not drawn)  (no BOM)
TP14  TEST POINT 0.5mm Dia  [Test-point - 0.5mm]  (value not drawn)  (no BOM)
TP15  TEST POINT 0.5mm Dia  [Test-point - 0.5mm]  (value not drawn)  (no BOM)
U13  TUSB4020BIPHPR  [48-HTQFP (7x7)]
U14  EC21EFA-512-STD  [EC21EFA-512-STD]
U15  TXS0108EPWR  [TSSOP-20]
X4  24MHz  [SMD5032-4P]

### Blocks framed on the sheet
VBAT_BB: C100-C103
VBAT_RF: C105-C108

### Nets
1.1V-HUB: FB2.1
3.3V-HUB: FB1.1 R92.2 R94.2
+3.3V: C140.2 U15.19(V)
+3.8V: C100.1 C101.2 C102.2 C103.2 C105.1 C106.2 C107.2 C108.2 C143.2 D11.1(A) R97.2 R98.2 R99.2 R114.2 U14.57(VBAT_RF) U14.58(VBAT_RF) U14.59(VBAT_BB) U14.60(VBAT_BB)
+5V: C104.2 R88.1 R96.2
+EXT: C139.2 R103.2 R104.2 R111.2 U14.7(VDD_EXT) U15.2(VCCA)
+USIM: U14.14(USIM_VDD)
GND: C99.1 C100.2 C101.1 C102.1 C103.1 C104.1 C105.2 C106.1 C107.1 C108.1 C109.1 C110.1 C111.1 C112.1 C113.1 C114.1 C115.1 C116.1 C117.1 C118.1 C119.1 C120.1 C121.1 C122.1 C123.1 C124.1 C125.1 C126.1 C127.1 C128.1 C129.1 C130.1 C131.1 C132.1 C133.1 C134.1 C135.1 C136.1 C137.1 C138.1 C139.1 C140.1 C141.1 C142.1 C143.1 C145.1 C146.1 D15.2(A) D16.2(A) J5.2(GND) J5.3(GND) J6.2(GND) J6.3(GND) J7.1 J8.2(GND) J8.3(GND) Q2.1(E) Q3.1(E) Q4.1(E) Q5.1(E) R87.1 R89.1 R90.1 R91.1 R95.1 R100.2 R102.2 U13.49(EXP) U14.8(GND) U14.9(GND) U14.10(USIM_GND) U14.19(GND) U14.22(GND) U14.36(GND) U14.46(GND) U14.48(GND) U14.50(GND) U14.51(GND) U14.52(GND) U14.53(GND) U14.54(GND) U14.56(GND) U14.72(GND) U14.85(GND) U14.86(GND) U14.87(GND) U14.88(GND) U14.89(GND) U14.90(GND) U14.91(GND) U14.92(GND) U14.93(GND) U14.94(GND) U14.95(GND) U14.96(GND) U14.97(GND) U14.98(GND) U14.99(GND) U14.100(GND) U14.101(GND) U14.102(GND) U14.103(GND) U14.104(GND) U14.105(GND) U14.106(GND) U14.107(GND) U14.108(GND) U14.109(GND) U14.110(GND) U14.111(GND) U14.112(GND) U15.11(GND) X4.2(GND) X4.4(GND)
VDD11: C124.2 C125.2 C126.2 C127.2 C128.2 C129.2 C130.2 C131.2 C132.2 C133.2 C134.2 C135.2 C136.2 FB2.2 U13.1(VDD) U13.12(VDD) U13.18(VDD) U13.30(VDD) U13.34(VDD) U13.45(VDD)
VDD33: C111.2 C112.2 C113.2 C114.2 C115.2 C116.2 C117.2 C118.2 C119.2 C120.2 C121.2 C122.2 C123.2 FB1.2 U13.7(VDD33) U13.13(VDD33) U13.23(VDD33) U13.25(VDD33) U13.33(VDD33) U13.37(VDD33) U13.40(VDD33) U13.48(VDD33)
ANT_DIV: C142.2 R109.2 U14.35(ANT_DIV)
ANT_GNSS: C146.2 R113.2 U14.47(ANT_GNSS)
ANT_MAIN: C138.2 R101.2 U14.49(ANT_MAIN)
AP_RDY: J7.3 U14.2(AP_READY)
BOOT: J7.2 R110.1 U14.115(USB_BOOT)
DBG_RXD: J7.6 U14.11(DBG_RXD)
DBG_TXD: J7.7 U14.12(DBG_TXD)
EC_CTS: R108.1 U14.64(CTS)
EC_DCD: U14.63(DCD) U15.3(A2)
EC_DTR: U14.66(DTR) U15.7(A6)
EC_PWR: Q4.3(C) R99.1 R100.1 U14.21(PWRKEY)
EC_RI: U14.62(RI) U15.6(A5)
EC_RST: Q5.3(C) R103.1 U14.20(RESET_N)
EC_RTS: R107.1 U14.65(RTS)
EC_RXD: R105.1 U14.68(RXD)
EC_STATUS: LED8.2 U14.61(STATUS)
EC_TXD: R106.1 U14.67(TXD)
GSM_CTS: U15.12(B8)
GSM_DCD: U15.18(B2)
GSM_DTR: U15.14(B6)
GSM_PWR: Q4.2(B)
GSM_RI: U15.15(B5)
GSM_RST: Q5.2(B)
GSM_RTS: U15.13(B7)
HUB_XI: C109.2 R93.1 U13.38(XI) X4.1(CRYSTAL)
HUB_XO: C110.2 R93.2 U13.39(XO) X4.3(CRYSTAL)
NET_MODE: Q3.2(B) U14.5(NET_MODE)
NET_STATUS: Q2.2(B) U14.6(NET_STATUS)
UART2_RX: U15.16(B4)
UART2_TX: U15.17(B3)
USB-D_N: U13.27(USB_DM_UP)
USB-D_P: U13.26(USB_DP_UP)
USB-GSM-D_N: J7.9 U13.42(USB_DM_DN1) U14.70(USB_DM)
USB-GSM-D_P: J7.8 U13.41(USB_DP_DN1) U14.69(USB_DP)
USB-PD-D_N: U13.15(UDB_DM_DN2)
USB-PD-D_P: U13.14(USB_DP_DN2)
USB_VBUS: J7.10 R96.1 U14.71(USB_VBUS)
USIM_CLK: U14.16(USIM_CLK)
USIM_DATA: U14.15(USIM_DATA)
USIM_PRE: U14.13(USIM_PRESENCE)
USIM_RST: U14.17(USIM_RST)
W_DIS: J7.4 U14.4(W_DISABLE#)
WAKEUP: J7.5 U14.1(WAKEUP_IN)
NetC99_2: C99.2 U13.11(GRSTZ)
NetC137_2: C137.2 D15.1(K) J5.1(RF_IN) R101.1
NetC141_2: C141.2 D16.1(K) J6.1(RF_IN) R109.1
NetC144_1: C144.1 C145.2 R113.1
NetC144_2: C144.2 J8.1(RF_IN) L7.2
NetD11_2: D11.2(K) R112.1
NetL7_1: L7.1 R112.2
NetLED6_1: LED6.1 Q2.3(C)
NetLED6_2: LED6.2 R97.1
NetLED7_1: LED7.1 Q3.3(C)
NetLED7_2: LED7.2 R98.1
NetLED8_1: LED8.1 R114.1
NetR87_2: R87.2 U13.24(USB_R1)
NetR88_2: R88.2 R89.2 U13.9(USB_VBUS)
NetR90_2: R90.2 U13.35(GANGED/SMBA2/HS_UP)
NetR91_2: R91.2 U13.36(FULLPWRMGMTZ/SMBA1)
NetR92_1: R92.1 U13.5(OVERCUR1Z)
NetR94_1: R94.1 U13.8(OVERCUR2Z)
NetR95_2: R95.2 U13.10(TEST)
NetR102_1: R102.1 R104.1 U15.10(OE)
NetR105_2: R105.2 U15.4(A3)
NetR106_2: R106.2 U15.5(A4)
NetR107_2: R107.2 U15.8(A7)
NetR108_2: R108.2 U15.9(A8)
NetR110_2: R110.2 R111.1
NetTP8_1: TP8.1 U14.34(VDD_SDIO)
NetTP9_1: TP9.1 U13.2(SCL/SMBCLK)
NetTP10_1: TP10.1 U14.128(USIM2_VDD)
NetTP11_1: TP11.1 U13.3(SDA/SMBDAT)
NetTP12_1: TP12.1 U13.22(SMBUSZ)
NetTP13_1: TP13.1 U13.21(PWRCTL_POL)
NetTP14_1: TP14.1 U13.4(PWRCTL1/BATEN1)
NetTP15_1: TP15.1 U13.6(PWRCTL2/BATEN2)

Not connected (* = marked no-connect by the designer): U13 16(RSVD)* 17(RSVD)* 19(RSVD)* 20(RSVD)* 28(RSVD)* 29(RSVD)* 31(RSVD)* 32(RSVD)* 43(RSVD)* 44(RSVD)* 46(RSVD)* 47(RSVD)*; U14 3(RESERVED)* 18(RESERVED)* 23(SD_INS_DET)* 24(PCM_IN)* 25(PCM_OUT)* 26(PCM_SYNC)* 27(PCM_CLK)* 28(SDC2_DATA3)* 29(SDC2_DATA2)* 30(SDC2_DATA1)* 31(SDC2_DATA0)* 32(SDC2_CLK)* 33(SDC2_CMD)* 37(BT_RTS)* 38(BT_TXD)* 39(BT_RXD)* 40(BT_CTS)* 41(I2C_SCL)* 42(I2C_SDA)* 43(RESERVED)* 44(ADC1)* 45(ADC0)* 55(RESERVED)* 113(RESERVED)* 114(RESERVED)* 116(RESERVED)* 117(RESERVED)* 118(WLAN_SLP_CLK)* 119(EPHY_RST_N)* 120(EPHY_INT_N)* 121(SGMII_MDATA)* 122(SGMII_MCLK)* 123(SGMII_TX_M)* 124(SGMII_TX_P)* 125(SGMII_RX_P)* 126(SGMII_RX_M)* 127(PM_ENABLE)* 129(SDC1_DATA3)* 130(SDC1_DATA2)* 131(SDC1_DATA1)* 132(SDC1_DATA0)* 133(SDC1_CLK)* 134(SDC1_CMD)* 135(WAKE_ON_WIRELESS)* 136(WLAN_EN)* 137(COEX_UART_RX)* 138(COEX_UART_TX)* 139(BT_EN)* 140(RESERVED)* 141(RESERVED)* 142(RESERVED)* 143(RESERVED)* 144(RESERVED)*; U15 1(A1)* 20(B1)*

### Layout directives
differential pair; differential pair class DIFF_USB: USB-D_N, USB-D_P, USB-GSM-D_N, USB-GSM-D_P, USB-PD-D_N, USB-PD-D_P

### Notes on the sheet
- EC21 GSM STANDARD MODULE
- GSM USB HUB
- GSM ANTENNA CONNECTORS
- GSM 1.8V TO 3.3V LEVEL SHIFTER
- GSM OTHER UNUSED PINS
- +5V
- Reflect Ein Technology Labs Sdn Bhd
- File:
- Title:
- Date:
- Page
- Num:
- Total:
- Drawn By: Nabil bin Feisal Bamadhaj